# EasyEDA Pro project ProPrj_LogicV2_2025-08-26.epro

# Schematic LogicV2
Board Name: LogicV2; Create Date: 2025-08-20; Page Name: P1; Project Name: LogicV2; Schematic Name: LogicV2; Update Date: 2025-08-20; Company: 嘉立创EDA; Page Size: A4; Version: V1.0
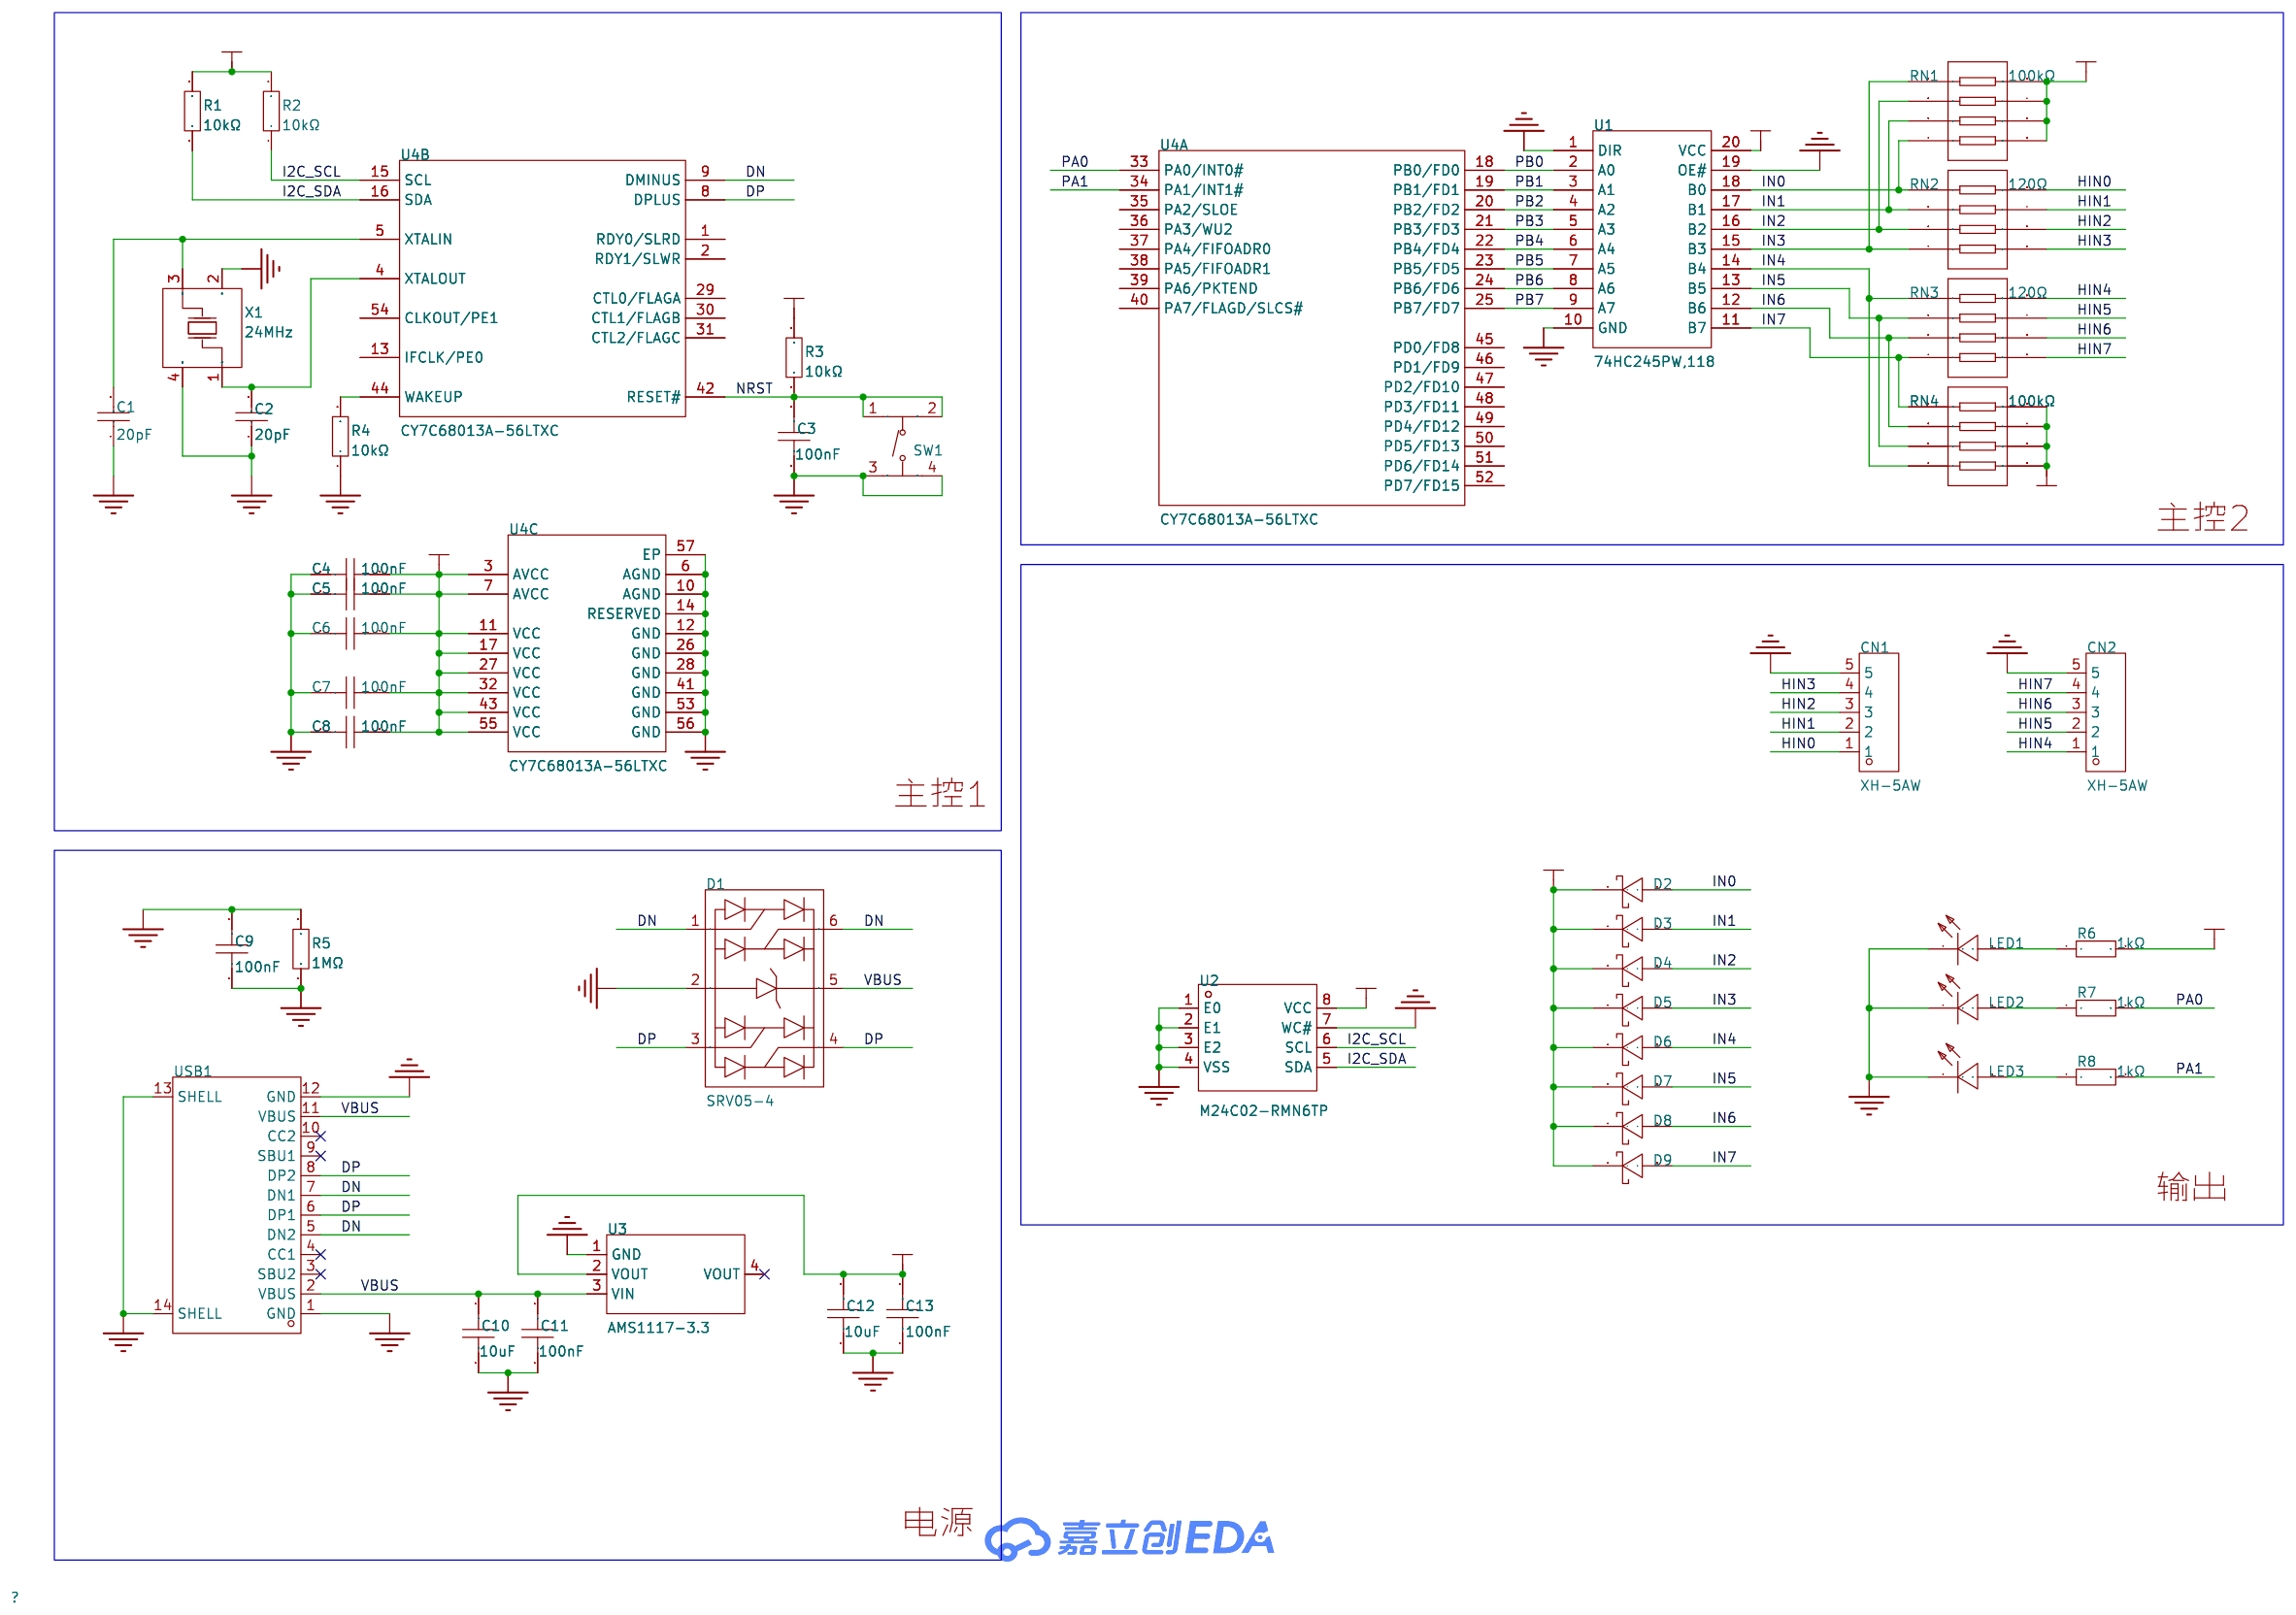
[diagram p0: schematic sheet]

## Parts
C1  20pF  [C0603]
C2  20pF  [C0603]
C3  100nF  [C0603]
C4  100nF  [C0603]
C5  100nF  [C0603]
C6  100nF  [C0603]
C7  100nF  [C0603]
C8  100nF  [C0603]
C9  100nF  [C0603]
C10  10uF  [C0805]
C11  100nF  [C0603]
C12  10uF  [C0805]
C13  100nF  [C0603]
CN1  XH-5AW  [CONN-TH_5P-P2.54_XH-5AW_C2908614]
CN2  XH-5AW  [CONN-TH_5P-P2.54_XH-5AW_C2908614]
D1  SRV05-4  [SOT-23-6_L2.9-W1.6-P0.95-LS2.8-BL]
D2  B5819W SL  [SOD-123_L2.7-W1.6-LS3.7-RD-1]
D3  B5819W SL  [SOD-123_L2.7-W1.6-LS3.7-RD-1]
D4  B5819W SL  [SOD-123_L2.7-W1.6-LS3.7-RD-1]
D5  B5819W SL  [SOD-123_L2.7-W1.6-LS3.7-RD-1]
D6  B5819W SL  [SOD-123_L2.7-W1.6-LS3.7-RD-1]
D7  B5819W SL  [SOD-123_L2.7-W1.6-LS3.7-RD-1]
D8  B5819W SL  [SOD-123_L2.7-W1.6-LS3.7-RD-1]
D9  B5819W SL  [SOD-123_L2.7-W1.6-LS3.7-RD-1]
LED1  KT-0603R  [LED0603-RD]
LED2  KT-0603R  [LED0603-RD]
LED3  KT-0603R  [LED0603-RD]
R1  10kΩ  [R0603]
R2  10kΩ  [R0603]
R3  10kΩ  [R0603]
R4  10kΩ  [R0603]
R5  1MΩ  [R0603]
R6  1kΩ  [R0603]
R7  1kΩ  [R0603]
R8  1kΩ  [R0603]
RN1  100kΩ  [RES-ARRAY-SMD_0603-8P-L3.2-W1.6-BL]
RN2  120Ω  [RES-ARRAY-SMD_0603-8P-L3.2-W1.6-BL]
RN3  120Ω  [RES-ARRAY-SMD_0603-8P-L3.2-W1.6-BL]
RN4  100kΩ  [RES-ARRAY-SMD_0603-8P-L3.2-W1.6-BL]
SW1  TS-1187A-B-A-B  [SW-SMD_4P-L5.1-W5.1-P3.70-LS6.5-TL_H1.5]
U1  74HC245PW,118  [TSSOP-20_L6.5-W4.4-P0.65-LS6.4-BL]
U2  M24C02-RMN6TP  [SOIC-8_L4.9-W3.9-P1.27-LS6.0-BL]
U3  AMS1117-3.3  [SOT-223-3_L6.5-W3.4-P2.30-LS7.0-BR]
U4  CY7C68013A-56LTXC  [QFN-56_L8.0-W8.0-P0.50-BL-EP6.1]  (sections 1,2,3)
USB1  TYPE-C 16PIN 2MD(073)  [USB-C-SMD_TYPE-C-6PIN-2MD-073]
X1  24MHz  [CRYSTAL-SMD_4P-L3.2-W2.5-BL]

## Library data of the parts
C1 C2 = CL10C200JB8NNNC: 容值:20pF;精度:±5%;额定电压:50V;温度系数:C0G;; LCSC Part Name: 20pF ±5% 50V; Supplier Part: C1648; Manufacturer: SAMSUNG(三星); Supplier Footprint: 0603; JLCPCB Part Class: 基础库; Datasheet: https://item.szlcsc.com/datasheet/CL10C200JB8NNNC/2000.html; Supplier: LCSC; Tolerance: ±5%; Voltage Rating: 50V; Temperature Coefficient: C0G
C3-C9 C11 C13 = CC0603KRX7R9BB104: 容值:100nF;精度:±10%;额定电压:50V;温度系数:X7R;; LCSC Part Name: 100nF ±10% 50V; Supplier Part: C14663; Manufacturer: YAGEO(国巨); Supplier Footprint: 0603; JLCPCB Part Class: 基础库; Datasheet: https://atta.szlcsc.com/upload/public/pdf/source/20250214/096C4C206003071F5D32E5F0D8E7F8DF.pdf; Supplier: LCSC; Tolerance: ±10%; Voltage Rating: 50V; Temperature Coefficient: X7R
C10 C12 = CL21A106KAYNNNE_C15850: 容值:10uF;精度:±10%;额定电压:25V;温度系数:X5R;; LCSC Part Name: 10uF ±10% 25V; Supplier Part: C15850; Manufacturer: SAMSUNG(三星); Manufacturer Part: CL21A106KAYNNNE; Supplier Footprint: 0805; JLCPCB Part Class: 基础库; Datasheet: https://item.szlcsc.com/datasheet/CL21A106KAYNNNE/16532.html; Supplier: LCSC; Tolerance: ±10%; Voltage Rating: 25V; Temperature Coefficient: X5R
CN1 CN2 = XH-5AW: 插针结构:1x5P;间距:2.54mm;安装方式:弯插;参考系列:XH;总PIN数:5P;排数:1;每排PIN数:5;行距:-;额定电流:3A;触头材质:黄铜;触头镀层:锡;工作温度:-25℃~+85℃;; LCSC Part Name: 1x5P 间距:2.54mm 弯插 系列:XH; Supplier Part: C2908614; Manufacturer: HCTL(华灿天禄); Supplier Footprint: 弯插,P=2.5mm; JLCPCB Part Class: 扩展库; Datasheet: https://item.szlcsc.com/datasheet/XH-5AW/3184385.html; Supplier: LCSC; Pins Structure: 1x5P; Pitch: 2.54mm; Mounting Type: 弯插; Reference Series: XH; Number of Pins: 5P; Number of Rows: 1; Number of PINs Per Row: 5; Current Rating: 3A; Contact Material: 黄铜; Contact Plating: 锡; Operating Temperature: -25℃~+85℃
D1 = SRV05-4_C558418: 极性:单向;反向截止电压(Vrwm):5V;最大钳位电压:20V;峰值脉冲电流(Ipp):3A;峰值脉冲功率(Ppp):60W;击穿电压:6V;; LCSC Part Name: ESD，可防25kV静电; Supplier Part: C558418; Manufacturer: TECH PUBLIC(台舟); Supplier Footprint: SOT-23-6; JLCPCB Part Class: 扩展库; Datasheet: https://atta.szlcsc.com/upload/public/pdf/source/20230615/CFFDFFE99FDA0E92DF9600783B3A2A20.pdf; Supplier: LCSC; polarity: 单向; Reverse Stand-Off Voltage (Vrwm): 5V; Maximum Clamping Voltage: 20V; Peak Pulse Current (Ipp): 3A; Peak Pulse Power Dissipation (Ppp): 60W; Breakdown Voltage: 6V; Reverse Leakage Current (Ir): 500nA; Number of Lines: 四路; Operating Temperature: -55℃~+125℃; level of protection: IEC 61000-4-2; Type: ESD
D2-D9 = B5819W SL: 正向压降(Vf):600mV@1A;直流反向耐压(Vr):40V;整流电流:1A;; LCSC Part Name: 电压:40V 电流:1A; Supplier Part: C8598; Manufacturer: CJ(江苏长电/长晶); Supplier Footprint: SOD-123; JLCPCB Part Class: 基础库; Datasheet: https://item.szlcsc.com/datasheet/B5819W%2520SL/9093.html; Supplier: LCSC; Voltage - Forward(Vf@If): 600mV@1A; Voltage - DC Reverse(Vr): 40V; Current - Rectified: 1A; Non-Repetitive Peak Forward Surge Current: 9A
LED1-LED3 = KT-0603R: 发光颜色:红色;功率:-;正向电流:-;主波长:-;二极管配置:-;透镜颜色:-;色温:-;发光角度:-;载带方式:-;工作温度:-40℃~+85℃;; LCSC Part Name: 0603 红灯 高亮; Supplier Part: C2286; Manufacturer: KENTO; Supplier Footprint: 0603; JLCPCB Part Class: Basic Part; Datasheet: https://atta.szlcsc.com/upload/public/pdf/source/20160616/1466072038404.pdf; Supplier: LCSC; Emitted Color: 红色; Operating Temperature: -40℃~+85℃
R1-R4 = 0603WAF1002T5E: 电阻类型:厚膜电阻;阻值:10kΩ;精度:±1%;功率:100mW;工作电压:75V;温度系数:±100ppm/℃;; LCSC Part Name: 厚膜电阻 10kΩ ±1% 100mW; Supplier Part: C25804; Manufacturer: UNI-ROYAL(厚声); Supplier Footprint: 0603; JLCPCB Part Class: 基础库; Datasheet: https://item.szlcsc.com/datasheet/0603WAF1002T5E/26547.html; Supplier: LCSC; Type: 厚膜电阻; Tolerance: ±1%; Power(Watts): 100mW; Voltage-Supply(Max): 75V; Temperature Coefficient: ±100ppm/℃; Operating Temperature: -55℃~+155℃
R5 = 0603WAF1004T5E: 电阻类型:厚膜电阻;阻值:1MΩ;精度:±1%;功率:100mW;最大工作电压:75V;温度系数:±100ppm/℃;; LCSC Part Name: 1MΩ ±1% 100mW 厚膜电阻; Supplier Part: C22935; Manufacturer: UNI-ROYAL(厚声); Supplier Footprint: 0603; JLCPCB Part Class: 基础库; Datasheet: https://atta.szlcsc.com/upload/public/pdf/source/20200306/C422600_1E6D84923E4A46A82E41ADD87F860B5C.pdf; Supplier: LCSC; Type: 厚膜电阻; Tolerance: ±1%; Power(Watts): 100mW; Overload Voltage (Max): 75V; Temperature Coefficient: ±100ppm/℃; Operating Temperature Range: -55℃~+155℃
R6-R8 = 0603WAF1001T5E: 电阻类型:厚膜电阻;阻值:1kΩ;精度:±1%;功率:100mW;最大工作电压:75V;温度系数:±100ppm/℃;; LCSC Part Name: 1kΩ ±1% 100mW 厚膜电阻; Supplier Part: C21190; Manufacturer: UNI-ROYAL(厚声); Supplier Footprint: 0603; JLCPCB Part Class: 基础库; Datasheet: https://atta.szlcsc.com/upload/public/pdf/source/20200306/C422600_1E6D84923E4A46A82E41ADD87F860B5C.pdf; Supplier: LCSC; Type: 厚膜电阻; Tolerance: ±1%; Power(Watts): 100mW; Overload Voltage (Max): 75V; Temperature Coefficient: ±100ppm/℃; Operating Temperature Range: -55℃~+155℃
RN1 RN4 = 4D03WGJ0104T5E: 电阻器数:4;阻值:100kΩ;精度:±5%;单个元件功率:62.5mW;温度系数:±200ppm/℃;; LCSC Part Name: 100kΩ ±5%; Supplier Part: C1996; Manufacturer: UNI-ROYAL(厚声); Supplier Footprint: 0603x4; JLCPCB Part Class: 扩展库; Datasheet: https://atta.szlcsc.com/upload/public/pdf/source/20191224/C474318_2527498AE30E813171187CCD28401A71.pdf; Supplier: LCSC; Number of Resistors: 4; Tolerance: ±5%; Power(Watts): 62.5mW; Temperature Coefficient: ±200ppm/℃; Number of Pins: 8
RN2 RN3 = 4D03WGJ0121T5E: 电阻器数:4;阻值:120Ω;精度:±5%;单个元件功率:62.5mW;温度系数:±200ppm/℃;; LCSC Part Name: 120Ω ±5%; Supplier Part: C35457; Manufacturer: UNI-ROYAL(厚声); Supplier Footprint: 0603x4; JLCPCB Part Class: 扩展库; Datasheet: https://atta.szlcsc.com/upload/public/pdf/source/20191224/C474318_2527498AE30E813171187CCD28401A71.pdf; Supplier: LCSC; Number of Resistors: 4; Tolerance: ±5%; Power(Watts): 62.5mW; Temperature Coefficient: ±200ppm/℃; Number of Pins: 8
SW1 = TS-1187A-B-A-B: 电路结构:单刀单掷;按钮形状:圆形按钮;作用力:160gf;安装方式:立贴;开关长度:5.1mm;开关宽度:5.1mm;开关高度:1.5mm;带支架:不带;触点电流:50mA;额定电压(DC):12V;绝缘电阻:-;带灯:无;机械寿命:10万次;; LCSC Part Name: 5.1*5.1*1.5mm 立贴 轻触开关; Supplier Part: C318884; Manufacturer: XKB Connectivity(中国星坤); Supplier Footprint: SMD; JLCPCB Part Class: 基础库; Datasheet: https://atta.szlcsc.com/upload/public/pdf/source/20200227/C318890_053E50208A88A7BA1965D8746000774E.pdf; Supplier: LCSC; Circuit: 单刀单掷; Actuator Style: 圆形按钮; Operating Force: 160gf; Mounting Style: 立贴; Switch Length: 5.1mm; Switch Width: 5.1mm; Switch Height: 1.5mm; Strike Gundam: 不带; Contact Current: 50mA; Voltage Rating (DC): 12V; Actuator/Cap Color: 金色; With Lamp: 无; Mechanical Life: 10万次; Operating Temperature: -30℃~+85℃
U1 = 74HC245PW,118: 输入类型:-;工作电压:2V~6V;元件数:1;每个元件位数:8;灌电流(IOL):7.8mA;拉电流(IOH):7.8mA;; Supplier Part: C5626; Manufacturer: Nexperia(安世); Supplier Footprint: TSSOP-20; JLCPCB Part Class: 扩展库; Datasheet: https://atta.szlcsc.com/upload/public/pdf/source/20240724/EDC8C45902BA97AEC59E8811E3964917.pdf; Supplier: LCSC; output type: 三态; Voltage - Supply: 2V~6V; Number of Elements: 1; Number of Bits per Element: 8; Current - Output Low(IOL): 7.8mA; Current - Output High(IOH): 7.8mA; Logic Family: 74HC; Operating Temperature: -40℃~+125℃
U2 = M24C02-RMN6TP: 接口类型:I2C;存储容量:2Kbit;; Supplier Part: C83836; Manufacturer: ST(意法半导体); Supplier Footprint: SOIC-8; JLCPCB Part Class: 扩展库; Datasheet: https://atta.szlcsc.com/upload/public/pdf/source/20170713/C118273_1499918870536816701.pdf; Supplier: LCSC; Interface Type: I2C; Memory Size: 2Kbit; Supply Voltage: 1.8V~5.5V; Write Cycle Time (Tw): 5ms; Data Retention - TDR (Year): 200年; Write Cycle Endurance: 1200000次; Operating Temperature: -40℃~+85℃
U3 = AMS1117-3.3_C6186: 输出类型:固定;工作电压:16V;输出电压:3.3V;输出电流:1A;电源纹波抑制比(PSRR):72dB@(120Hz);输出极性:正极;; LCSC Part Name: 输出3.3V 1A; Supplier Part: C6186; Manufacturer: AMS; Supplier Footprint: SOT-223; JLCPCB Part Class: 基础库; Datasheet: https://item.szlcsc.com/datasheet/AMS1117-3.3/6652.html; Supplier: LCSC; Output Type: 固定; Voltage - Supply: 16V; Output Voltage: 3.3V; Output Current: 1A; Power Supply Rejection Ratio (PSRR): 72dB@(120Hz); Voltage Dropout: 1.1V@(800mA); standby current: 5mA; Features: 过流保护；过热保护; Operating Temperature: -40℃~+125℃; Output Configuration: 正极; Number of Outputs: 1
U4 = CY7C68013A-56LTXC_C14912: CPU内核:51系列;CPU最大主频:48MHz;应用领域:-;; Supplier Part: C14912; Manufacturer: Infineon/CYPRESS(赛普拉斯); Supplier Footprint: QFN-56-EP(8x8); JLCPCB Part Class: 扩展库; Datasheet: https://item.szlcsc.com/datasheet/CY7C68013A-56LTXC/15584.html; Supplier: LCSC; CPU Core: 51系列; CPU Maximum Speed: 48MHz; Program Memory Type: FLASH; Number of I/O: 24; Voltage - Supply: 3V~3.6V
USB1 = TYPE-C 16PIN 2MD(073): 连接器类型:Type-C;协议标准:USB 3.1;公母:母;安装方式:卧贴;触点数量:16P;端口数量:1;额定电流 - 电源:3A;工作温度:-25℃~+85℃;; LCSC Part Name: Type-C 母 卧贴; Supplier Part: C2765186; Manufacturer: SHOU HAN(首韩); Supplier Footprint: SMD; JLCPCB Part Class: 扩展库; Datasheet: https://item.szlcsc.com/datasheet/TYPE-C%252016PIN%25202MD(073)/2901843.html; Supplier: LCSC; Connector Type: Type-C; Protocol Standard: USB 3.1; Gender: 母; Mounting Type: 卧贴; Number of Contacts: 16P; Number of Ports: 1; Current Rating-Power: 3A; Voltage Rating: 5V; Connect-Disconnect Life: 5千次; Detection color: 黑色; Operating Temperature: -25℃~+85℃
X1 = X322524MSB4SI: 晶振类型:贴片晶振;频率:24MHz;常温频差:±10ppm;负载电容:20pF;频率稳定度:±20ppm;; LCSC Part Name: YSX321SL 24MHZ 4P 3225 20PF ±10PPM -40~85℃ (±20PPM); Supplier Part: C15643; Manufacturer: YXC(扬兴晶振); Supplier Footprint: SMD3225-4P; JLCPCB Part Class: 扩展库; Datasheet: https://item.szlcsc.com/datasheet/X322524MSB4SI/16324.html; Supplier: LCSC; Type: 贴片晶振; Normal temperature Frequency Tolerance: ±10ppm; Load Capacitance: 20pF; Frequency Stability: ±20ppm; Operating Temperature: -40℃~+85℃

## Nets
3V3: C4.2 C5.2 C6.2 C7.2 C8.2 C12.2 C13.2 D2.1(-) D3.1(-) D4.1(-) D5.1(-) D6.1(-) D7.1(-) D8.1(-) D9.1(-) R1.2 R2.2 R3.2 R6.2 RN1.5 RN1.6 RN1.7 RN1.8 RN4.5 RN4.6 RN4.7 RN4.8 U1.20(VCC) U2.8(VCC) U3.2(VOUT) U4.3(AVCC) U4.7(AVCC) U4.11(VCC) U4.17(VCC) U4.27(VCC) U4.32(VCC) U4.43(VCC) U4.55(VCC)
GND: C1.1 C2.1 C3.1 C4.1 C5.1 C6.1 C7.1 C8.1 C9.1 C10.1 C11.1 C12.1 C13.1 CN1.5 CN2.5 D1.2 LED1.1(K) LED2.1(K) LED3.1(K) R4.1 R5.1 SW1.3(C) SW1.4(D) U1.1(DIR) U1.10(GND) U1.19(OE#) U2.1(E0) U2.2(E1) U2.3(E2) U2.4(VSS) U2.7(WC#) U3.1(GND) U4.6(AGND) U4.10(AGND) U4.12(GND) U4.14(RESERVED) U4.26(GND) U4.28(GND) U4.41(GND) U4.53(GND) U4.56(GND) U4.57(EP) USB1.1(GND) USB1.12(GND) X1.2(GND) X1.4(GND)
VBUS: C10.2 C11.2 D1.5 U3.3(VIN) USB1.2(VBUS) USB1.11(VBUS)
DN: D1.1 D1.6 U4.9(DMINUS) USB1.5(DN2) USB1.7(DN1)
DP: D1.3 D1.4 U4.8(DPLUS) USB1.6(DP1) USB1.8(DP2)
EGND: C9.2 R5.2 USB1.13(SHELL) USB1.14(SHELL)
HIN0: CN1.1 RN2.8
HIN1: CN1.2 RN2.7
HIN2: CN1.3 RN2.6
HIN3: CN1.4 RN2.5
HIN4: CN2.1 RN3.8
HIN5: CN2.2 RN3.7
HIN6: CN2.3 RN3.6
HIN7: CN2.4 RN3.5
I2C_SCL: R2.1 U2.6(SCL) U4.15(SCL)
I2C_SDA: R1.1 U2.5(SDA) U4.16(SDA)
IN0: D2.2(+) RN1.4 RN2.1 U1.18(B0)
IN1: D3.2(+) RN1.3 RN2.2 U1.17(B1)
IN2: D4.2(+) RN1.2 RN2.3 U1.16(B2)
IN3: D5.2(+) RN1.1 RN2.4 U1.15(B3)
IN4: D6.2(+) RN3.1 RN4.4 U1.14(B4)
IN5: D7.2(+) RN3.2 RN4.3 U1.13(B5)
IN6: D8.2(+) RN3.3 RN4.2 U1.12(B6)
IN7: D9.2(+) RN3.4 RN4.1 U1.11(B7)
NRST: C3.2 R3.1 SW1.1(A) SW1.2(B) U4.42(RESET#)
PA0: R7.2 U4.33(PA0/INT0#)
PA1: R8.2 U4.34(PA1/INT1#)
PB0: U1.2(A0) U4.18(PB0/FD0)
PB1: U1.3(A1) U4.19(PB1/FD1)
PB2: U1.4(A2) U4.20(PB2/FD2)
PB3: U1.5(A3) U4.21(PB3/FD3)
PB4: U1.6(A4) U4.22(PB4/FD4)
PB5: U1.7(A5) U4.23(PB5/FD5)
PB6: U1.8(A6) U4.24(PB6/FD6)
PB7: U1.9(A7) U4.25(PB7/FD7)
$1N986: C1.2 U4.5(XTALIN) X1.3(OSC2)
$1N999: C2.2 U4.4(XTALOUT) X1.1(OSC1)
$1N1303: R4.2 U4.44(WAKEUP)
$1N5358: LED2.2(A) R7.1
$1N5363: LED1.2(A) R6.1
$1N5368: LED3.2(A) R8.1

Not connected (* = marked no-connect by the designer): U3 4(VOUT)*; U4 1(RDY0/SLRD) 2(RDY1/SLWR) 13(IFCLK/PE0) 29(CTL0/FLAGA) 30(CTL1/FLAGB) 31(CTL2/FLAGC) 35(PA2/SLOE) 36(PA3/WU2) 37(PA4/FIFOADR0) 38(PA5/FIFOADR1) 39(PA6/PKTEND) 40(PA7/FLAGD/SLCS#) 45(PD0/FD8) 46(PD1/FD9) 47(PD2/FD10) 48(PD3/FD11) 49(PD4/FD12) 50(PD5/FD13) 51(PD6/FD14) 52(PD7/FD15) 54(CLKOUT/PE1); USB1 3(SBU2)* 4(CC1)* 9(SBU1)* 10(CC2)*

## Notes on the sheet
- 主控2
- 主控1
- 输出
- 电源

# Board Logic-250820
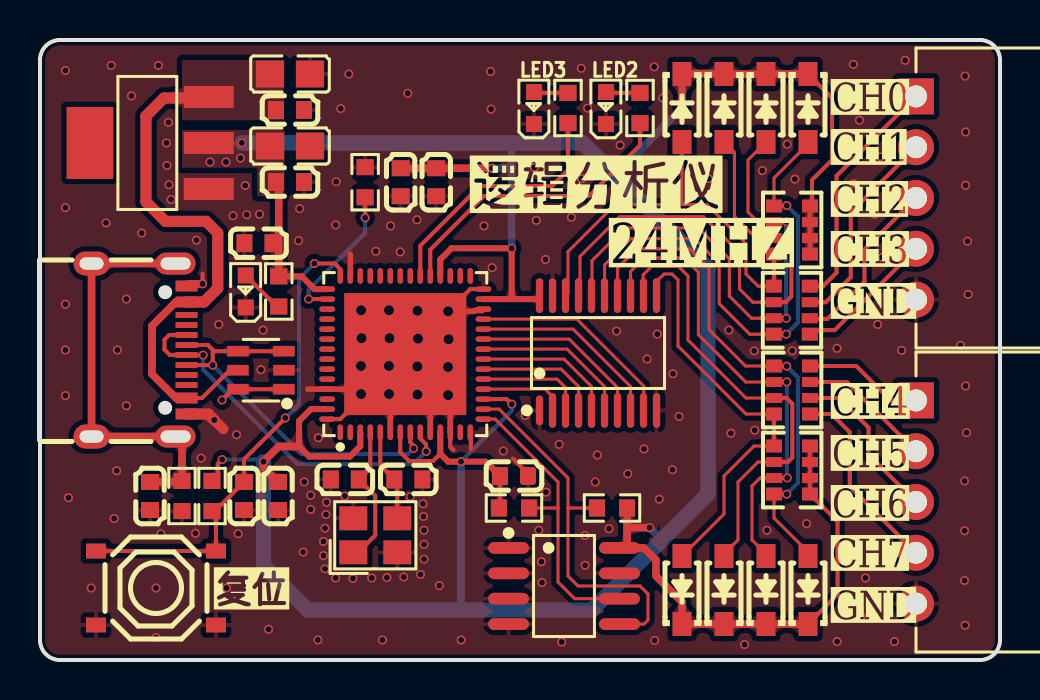
[diagram p1: board, top side]
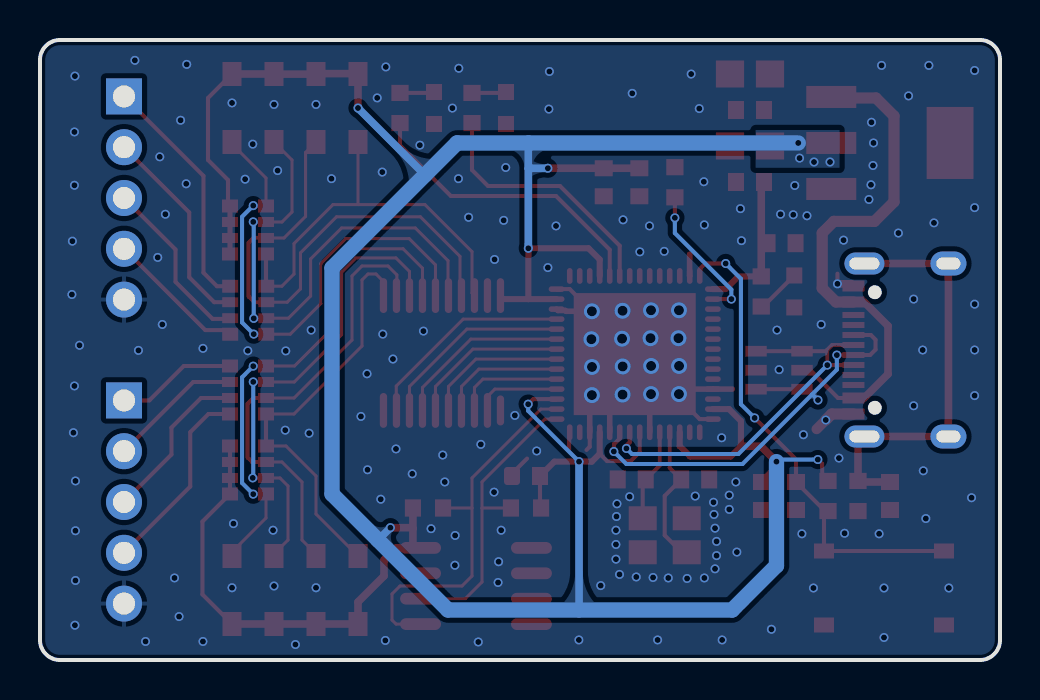
[diagram p2: board, bottom side, seen from below]

Outline 48 x 31 mm; copper layers: Top Layer, Bottom Layer. Coordinates in mm from the lower left corner of the outline.
Outline path: 0,30 0,1 arc(0.29,0.29) 1,0 47,0 arc(47.71,0.29) 48,1 48,30 arc(47.71,30.71) 47,31 1,31 arc(0.29,30.71) 0,30
Stack: Top Layer 0.035mm / Dielectric1 1.51mm FR4 er 4.5 / Bottom Layer 0.035mm

## Design rules (mm)
template: 自定义配置
spacing copperThickness1oz (default): track to track 0.102, other pairs 0.152 to 0.3
spacing copperThickness2oz: track to track 0.203, other pairs 0.152 to 0.3
track width copperThickness1oz (default): min 0.127, default 0.203, max 2.54
track width copperThickness2oz: min 0.203, default 0.254, max 2.54
differential pair differentialPair (default): width min 0.127, default 0.254, max 2.54; gap min 0.152, default 0.152
via viaSize (default): diameter min 0.4, default 0.45, max 10; hole min 0.3, default 0.3, max 6.3

## Placement (name value [footprint] x y rotation side)
C1  20pF  [C0603]  18.41 9.03 180 top
C2  20pF  [C0603]  15.24 9.03 0 top
C3  100nF  [C0603]  10.2 8.2 90 top
C4  100nF  [C0603]  11.9 8.2 90 top
C5  100nF  [C0603#2]  23.7 9.2 180 top
C6  100nF  [C0603]  19.81 23.89 90 top
C7  100nF  [C0603]  18.03 23.89 90 top
C8  100nF  [C0603]  10.92 20.84 0 top
C9  100nF  [C0603]  5.5 8.2 90 top
C10  10uF  [C0805]  12.5 29.3 180 top
C11  100nF  [C0603]  12.5 27.5 180 top
C12  10uF  [C0805]  12.5 25.7 180 top
C13  100nF  [C0603]  12.5 23.9 180 top
CN1  XH-5AW  [CONN-TH_5P-P2.54_XH-5AW_C2908614]  43.8 23.1 270 top
CN2  XH-5AW  [CONN-TH_5P-P2.54_XH-5AW_C2908614]  43.8 7.9 270 top
D1  SRV05-4  [SOT-23-6_L2.9-W1.6-P0.95-LS2.8-BL]  11.05 14.49 90 top
D2  B5819W SL  [SOD-123_L2.7-W1.6-LS3.7-RD-1]  32.1 27.6 270 top
D3  B5819W SL  [SOD-123_L2.7-W1.6-LS3.7-RD-1]  34.2 27.6 270 top
D4  B5819W SL  [SOD-123_L2.7-W1.6-LS3.7-RD-1]  36.3 27.6 270 top
D5  B5819W SL  [SOD-123_L2.7-W1.6-LS3.7-RD-1]  38.4 27.6 270 top
D6  B5819W SL  [SOD-123_L2.7-W1.6-LS3.7-RD-1]  38.4 3.5 90 top
D7  B5819W SL  [SOD-123_L2.7-W1.6-LS3.7-RD-1]  36.3 3.5 90 top
D8  B5819W SL  [SOD-123_L2.7-W1.6-LS3.7-RD-1]  34.2 3.5 90 top
D9  B5819W SL  [SOD-123_L2.7-W1.6-LS3.7-RD-1]  32.1 3.5 90 top
LED1  KT-0603R  [LED0603-RD]  10.29 18.43 90 top
LED2  KT-0603R  [LED0603-RD]  28.3 27.6 90 top
LED3  KT-0603R  [LED0603-RD]  24.7 27.6 90 top
R1  10kΩ  [R0603]  28.6 7.6 0 top
R2  10kΩ  [R0603]  23.7 7.6 180 top
R3  10kΩ  [R0603]  8.6 8.2 90 top
R4  10kΩ  [R0603]  16.26 23.89 270 top
R5  1MΩ  [R0603]  7.1 8.2 90 top
R6  1kΩ  [R0603]  11.94 18.43 90 top
R7  1kΩ  [R0603]  30 27.6 270 top
R8  1kΩ  [R0603]  26.4 27.6 270 top
RN1  100kΩ  [RES-ARRAY-SMD_0603-8P-L3.2-W1.6-BL]  37.6 21.5 270 top
RN2  120Ω  [RES-ARRAY-SMD_0603-8P-L3.2-W1.6-BL]  37.59 17.49 270 top
RN3  120Ω  [RES-ARRAY-SMD_0603-8P-L3.2-W1.6-BL]  37.6 13.5 270 top
RN4  100kΩ  [RES-ARRAY-SMD_0603-8P-L3.2-W1.6-BL]  37.6 9.5 270 top
SW1  TS-1187A-B-A-B  [SW-SMD_4P-L5.1-W5.1-P3.70-LS6.5-TL_H1.5]  5.8 3.6 0 top
U1  74HC245PW,118  [TSSOP-20_L6.5-W4.4-P0.65-LS6.4-BL]  27.9 15.35 0 top
U2  M24C02-RMN6TP  [SOIC-8_L4.9-W3.9-P1.27-LS6.0-BL]  26.2 3.7 270 top
U3  AMS1117-3.3  [SOT-223-3_L6.5-W3.4-P2.30-LS7.0-BR]  5.47 25.85 0 top
U4  CY7C68013A-56LTXC  [QFN-56_L8.0-W8.0-P0.50-BL-EP6.1]  18.26 15.3 0 top
USB1  TYPE-C 16PIN 2MD(073)  [USB-C-SMD_TYPE-C-6PIN-2MD-073]  4.95 15.5 270 top
X1  24MHz  [CRYSTAL-SMD_4P-L3.2-W2.5-BL]  16.76 6.23 0 top

## Footprints (pads in the part's own frame, mm; a bottom-side part is the same pattern mirrored in y, then rotated)
C0603
  rect 0.8x0.9 smd: 1(-0.7,0) 2(0.7,0)
C0603#2
  rrect 0.8x0.9 smd: 1(-0.7,0)
  rect 0.8x0.9 smd: 2(0.7,0)
C0805
  rect 1.41x1.35 smd: 1(-1,0) 2(1,0)
CONN-TH_5P-P2.54_XH-5AW_C2908614
  rect 1.8x1.8 hole 1.1: 1(-5.08,0)
  round 1.8 hole 1.1: 2(-2.54,0) 3(0,0) 4(2.54,0) 5(5.08,0)
CRYSTAL-SMD_4P-L3.2-W2.5-BL
  rect 1.4x1.2 smd: 1(-1.1,-0.85) 2(1.1,-0.85) 3(1.1,0.85) 4(-1.1,0.85)
LED0603-RD
  rect 0.8x0.8 smd: 1(-0.799,0) 2(0.799,0)
QFN-56_L8.0-W8.0-P0.50-BL-EP6.1
  oval 0.28x0.79 smd: 1(-3.25,-3.908) 2(-2.75,-3.908) 3(-2.25,-3.908) 4(-1.75,-3.908) 5(-1.25,-3.908) 6(-0.75,-3.908) 7(-0.25,-3.908) 8(0.25,-3.908) 9(0.75,-3.908) 10(1.25,-3.908) 11(1.75,-3.908) 12(2.25,-3.908) 13(2.75,-3.908) 14(3.25,-3.908) 29(3.25,3.908) 30(2.75,3.908) 31(2.25,3.908) 32(1.75,3.908) 33(1.25,3.908) 34(0.75,3.908) 35(0.25,3.908) 36(-0.25,3.908) 37(-0.75,3.908) 38(-1.25,3.908) 39(-1.75,3.908) 40(-2.25,3.908) 41(-2.75,3.908) 42(-3.25,3.908)
  oval 0.79x0.28 smd: 15(3.908,-3.25) 16(3.908,-2.75) 17(3.908,-2.25) 18(3.908,-1.75) 19(3.908,-1.25) 20(3.908,-0.75) 21(3.908,-0.25) 22(3.908,0.25) 23(3.908,0.75) 24(3.908,1.25) 25(3.908,1.75) 26(3.908,2.25) 27(3.908,2.75) 28(3.908,3.25) 43(-3.908,3.25) 44(-3.908,2.75) 45(-3.908,2.25) 46(-3.908,1.75) 47(-3.908,1.25) 48(-3.908,0.75) 49(-3.908,0.25) 50(-3.908,-0.25) 51(-3.908,-0.75) 52(-3.908,-1.25) 53(-3.908,-1.75) 54(-3.908,-2.25) 55(-3.908,-2.75) 56(-3.908,-3.25)
  rect 6.1x6.1 smd: 57(0,0)
R0603
  rect 0.806x0.864 smd: 1(-0.753,0) 2(0.753,0)
RES-ARRAY-SMD_0603-8P-L3.2-W1.6-BL
  rect 0.65x0.8 smd: 1(-1.2,-0.9) 4(1.2,-0.9) 5(1.2,0.9) 8(-1.2,0.9)
  rect 0.5x0.8 smd: 2(-0.4,-0.9) 3(0.4,-0.9) 6(0.4,0.9) 7(-0.4,0.9)
SOD-123_L2.7-W1.6-LS3.7-RD-1
  rect 1.2x0.95 smd: 1(-1.7,0) 2(1.7,0)
SOIC-8_L4.9-W3.9-P1.27-LS6.0-BL
  oval 0.588x2.045 smd: 1(-1.905,-2.772) 2(-0.635,-2.772) 3(0.635,-2.772) 4(1.905,-2.772) 5(1.905,2.772) 6(0.635,2.772) 7(-0.635,2.772) 8(-1.905,2.772)
SOT-23-6_L2.9-W1.6-P0.95-LS2.8-BL
  rect 0.532x1.072 smd: 1(-0.95,-1.149) 2(0,-1.149) 3(0.95,-1.149) 4(0.95,1.149) 5(0,1.149) 6(-0.95,1.149)
SOT-223-3_L6.5-W3.4-P2.30-LS7.0-BR
  rect 2.5x1.1 smd: 1(2.97,-2.3) 2(2.97,0) 3(2.97,2.3)
  rect 2.34x3.6 smd: 4(-2.97,0)
SW-SMD_4P-L5.1-W5.1-P3.70-LS6.5-TL_H1.5
  rect 1x0.75 smd: 1(-3,1.85) 2(3,1.85) 3(-3,-1.85) 4(3,-1.85)
TSSOP-20_L6.5-W4.4-P0.65-LS6.4-BL
  oval 0.364x1.5 smd: 1(-2.925,-2.871)
  oval 0.364x1.742 smd: 2(-2.275,-2.871) 3(-1.625,-2.871) 4(-0.975,-2.871) 5(-0.325,-2.871) 6(0.325,-2.871) 7(0.975,-2.871) 8(1.625,-2.871) 9(2.275,-2.871) 10(2.925,-2.871) 11(2.925,2.871) 12(2.275,2.871) 13(1.625,2.871) 14(0.975,2.871) 15(0.325,2.871) 16(-0.325,2.871) 17(-0.975,2.871) 18(-1.625,2.871) 19(-2.275,2.871) 20(-2.925,2.871)
USB-C-SMD_TYPE-C-6PIN-2MD-073
  rect 0.55x1.1 smd: 1(-3.2,2.375) 2(-2.4,2.375) 11(2.4,2.375) 12(3.2,2.375)
  rect 0.3x1.1 smd: 3(-1.75,2.375) 4(-1.25,2.375) 5(-0.75,2.375) 6(-0.25,2.375) 7(0.25,2.375) 8(0.75,2.375) 9(1.25,2.375) 10(1.75,2.375)
  oval 1.1x2 hole 0.6x1.5: 13(-4.325,1.825) 14(4.325,1.825)
  oval 1.2x1.8 hole 0.6x1.2: 13(-4.325,-2.375) 14(4.325,-2.375)

## Nets
As in the schematic.

Pads without a net: U3 4; U4 1 2 13 29 30 31 35 36 37 38 39 40 45 46 47 48 49 50 51 52 54; USB1 3 4 9 10

## Via types
v1: diameter 0.45, hole 0.3, Top Layer to Bottom Layer, 191 vias
v2: diameter 0.8, hole 0.5, Top Layer to Bottom Layer, 16 vias

## Routing (per net, layer and track width the routed paths; a pad name or vN(x,y) marks a point on that pad's centre or on a via; arc(x,y) is an arc through that point)
3V3: length 181.6
  Top Layer w0.203: U4.7 18.01,10.39 18.46,9.95 19.65,9.95 20.01,10.31 ; D6.1 39.88,3.28 39.88,6.92 RN4.5 RN4.6 RN4.7 RN4.8 ; v1(9.11,10.02) 8.89,9.81 8.89,9.24 R3.2 ; U4.17 23.34,13.05 v1(23.59,12.79) ; C5.2 23,7.65 R2.2 ; RN1.8 38.6,22.8 38.6,24 39.6,25 39.6,28.1 D5.1
  Top Layer w0.254: RN1.5 RN1.6 RN1.7 RN1.8
  Top Layer w0.305: U4.11 20.01,10.31 20.41,9.92 v1(21.05,9.92) 22.28,9.92 C5.2 ; U4.3 16.01,10.69 15.49,10.17 13.46,10.17 12.95,10.68 12.95,11.95 13.55,12.55 U4.55 ; U4.27 23.59,18.05 ; 23.59,18.05 24.98,18.05 U1.20 ; 23.59,18.05 23.58,18.05 v1(23.58,20.59) 20.57,20.59 20.01,20.03 U4.32 ; U4.43 13.72,18.55 13.09,19.18 R6.2
  Top Layer w0.381: R6.2 11.94,23.76 C13.2 ; D5.1 D4.1 36.29,29.29 34.21,29.29 D3.1 34.18,29.32 32.12,29.32 D2.1 v1(32.1,27.6) ; v1(30.48,6.62) 29.39,6.62 29.35,6.58 ; 29.22,5.61 U2.8 ; 29.22,5.61 29.35,5.74 29.35,6.58 ; 29.22,5.61 30.19,5.61 30.8,5 30.8,4.2 32.1,2.9 D9.1 D8.1 D7.1 D6.1 ; 12.95,10.68 11.94,10.68 v1(11.18,9.92) 11.18,9.62 C4.2 ; C7.2 C6.2 v1(22.61,24.59) ; R1.2 29.35,6.58
  Bottom Layer w0.203: v1(9.11,10.02) 11.07,10.02 v1(11.18,9.92) ; v1(21.05,9.92) 23.59,12.46 v1(23.59,12.79)
  Bottom Layer w0.381: v1(23.58,20.59) 23.58,24.57 ; 23.58,24.57 23.58,25.85 ; 23.58,24.57 23.57,24.59 v1(22.61,24.59) ; v1(30.48,6.62) 31.1,6 ; v1(21.05,9.92) 21.05,2.5 ; v1(32.1,27.6) 28.75,24.25
  Bottom Layer w0.762: v1(10.09,25.85) 27.15,25.85 33.4,19.6 33.4,8.3 27.6,2.5 13.39,2.5 11.18,4.72 v1(11.18,9.92)
  vias: v1(8.5,24.9) v1(9.3,24.9) v1(10.02,25.09)
GND: length 29.4
  Top Layer w0.203: 21.54,10.55 21.54,11.36 U4.14 ; v2(20.41,17.44) 21.51,18.55 U4.28 ; 23.65,10.07 24.4,9.32 C5.1 ; 20.68,10.5 20.51,10.66 U4.12 ; v1(8.13,18.81) 8.13,19.32 ; 16.51,13.55 15.01,12.05 U4.56
  Top Layer w0.28: 15.52,20.28 15.52,19.21 U4.41 ; U4.57 v2(20.41,17.44) 21.7,17.44 21.74,17.48 22.1,17.48 U4.26 ; U4.6 17.51,14.55 ; U4.12 20.51,13.05 19.51,14.05 U4.10 ; 13.39,13.55 U4.53 16.51,13.55
  Top Layer w0.381: v1(8.13,18.81) 7.44,18.81 USB1.1
  Top Layer w0.508: v1(8.71,12) 9.17,11.54
  Top Layer w0.559: v1(8.71,12) 8.41,12.3 USB1.12
  vias: v1(1.27,29.48) v1(1.27,22.62) v1(1.27,17.79) v1(1.27,15.5) v1(1.27,13.22) v1(1.42,8.11) v1(2.56,3.6) v1(3.3,21.86) v1(3.56,29.73) v1(3.71,7.07) v1(3.84,9.46) v1(3.87,15.5) v1(4.32,18.05) v1(4.32,12.71) v1(4.57,28.21) v1(5.08,21.35) v1(5.8,3.6) v1(5.8,1.12) v1(5.92,29.73) v1(6.05,6.31) v1(6.32,25.85) v1(6.35,24.73) v1(6.43,26.89) v1(6.45,23.76) v1(6.55,23.02) v1(7.82,20.99) v1(7.77,6.34) v1(8.05,10.1) v1(8.94,16.78) v1(9.33,3.6) v1(9.65,22.21) v1(9.83,11.26) v1(9.91,6.31) v1(10.26,23.73) v1(10.34,22.26) v1(10.97,22.29) v1(11.04,14.52) v1(11.15,16.5) v1(11.43,1.54) v1(12.93,20.97) v1(12.98,22.57) v1(13.21,8.9) v1(13.16,5.4) v1(13.54,8.24) v1(13.54,7.53) v1(13.92,11.11) v1(13.89,1) v1(14.25,6.59) v1(14.17,5.93) v1(14.17,5.22) v1(14.25,4.56) v1(14.33,7.89) v1(14.3,7.28) v1(14.81,23.91) v1(14.78,21.75) v1(14.78,4.1) v1(15.04,27.57) v1(15.24,8.2) v1(15.44,29.3) v1(15.65,4.08) v1(16.59,4.1) v1(16.79,20.43) v1(17.12,1) v1(17.35,4.13) v1(17.53,21.7) v1(18.01,20.41) v1(18.19,4.15) v1(18.39,28.33) v1(18.52,8.17) v1(18.85,22.01) v1(19.02,4.28) v1(19.15,7.81) v1(19.18,7.17) v1(19.2,6.49) v1(19.2,5.78) v1(19.2,5.04) v1(19.96,3.72) v1(21.06,1) v1(22.2,21.7) v1(22.53,29.42) v1(22.56,27.55) v1(22.61,19.62) v1(23.16,10.45) v1(24.26,12.23) v1(24.71,24.62) v1(24.82,21.98) v1(24.94,6.49) v1(25.07,4.91) v1(25.1,3.87) v1(25.27,20.03) v1(25.3,8.39) v1(25.96,10.78) v1(26.09,0.9) v1(26.57,22.14) v1(27.06,29.59) v1(27.08,24.07) v1(27.24,6.23) v1(27.25,4.74) v1(27.38,27.6) v1(27.76,8.9) v1(27.86,10.25) v1(28.45,6.56) v1(28.83,16.45) v1(29.01,25.74) v1(29.39,9.31) v1(30.2,10.55) v1(30.35,15.05) v1(30.71,29.65) v1(30.73,0.98) v1(30.89,24.4) v1(30.86,16.29) v1(30.96,8.04) v1(31.14,28.1) v1(31.65,14.31) v1(31.62,9.51) v1(31.95,12.18) v1(33.43,24.07) v1(34.2,27.78) v1(34.2,3.61) v1(34.44,16.5) v1(34.54,11.34) v1(35.23,0.77) v1(35.71,15.45) v1(35.74,11.49) v1(36.12,24.47) v1(36.3,27.78) v1(36.35,6.49) v1(36.3,3.7) v1(37.36,25.79) v1(37.61,15.46) v1(37.74,24.04) v1(38.33,6.82) v1(38.4,27.85) v1(38.4,3.61) v1(39.85,15.58) v1(39.85,0.93) v1(40.67,29.78) v1(40.69,23.81) v1(40.97,26.99) v1(41.05,2.17) v1(41.28,4.1) v1(41.73,22.29) v1(41.88,16.78) v1(42.01,25.16) v1(42.11,20.13) v1(42.72,0.93) v1(43.08,15.48) v1(43.26,29.98) v1(46.03,15.73) v1(46.23,8.95) v1(46.23,6.46) v1(46.23,3.97) v1(46.25,29.2) v1(46.28,26.4) v1(46.28,23.74) v1(46.28,13.7) v1(46.33,11.37) v1(46.25,1.74) v1(46.38,20.94) v1(46.41,18.27) v2(16.05,14.7) v2(16.05,17.49) v2(16.08,16.09) v2(16.05,13.3) v2(17.45,17.49) v2(17.44,14.7) v2(17.45,13.3) v2(17.47,16.09) v2(18.87,17.46) v2(18.9,16.06) v2(18.87,14.68) v2(18.87,13.27) v2(20.43,16.04) v2(20.4,14.65) v2(20.41,13.25)
VBUS: length 26.1
  Top Layer w0.203: USB1.11 8.1,13.1 9.49,14.49 D1.5
  Top Layer w0.381: USB1.11 6.79,13.1 5.6,14.29 5.6,16.71 6.79,17.9 USB1.2
  Top Layer w0.559: 7.93,28.1 6.2,28.1 5.3,27.2 5.3,22.91 6.27,21.93 8.31,21.93 8.89,21.35 8.89,18.59 8.2,17.9 USB1.2
DN: length 22.7
  Top Layer w0.203: U4.9 19.01,11.08 19.3,10.79 19.3,10.43 v1(19.31,10.43) ; v1(9.1,13) 9.64,13.54 D1.6 D1.1 ; USB1.5 6.46,16.25 6.22,16.01 6.22,15.52 6.49,15.25 USB1.7 8.15,15.25 v1(8.16,15.25)
  Bottom Layer w0.203: v1(8.16,15.25) 8.16,14.52 9.41,13.27 ; v1(19.31,10.43) 18.68,9.8 12.87,9.8 9.41,13.27 ; 9.41,13.27 9.37,13.27 v1(9.1,13)
DP: length 19.9
  Top Layer w0.203: U4.8 18.51,10.89 18.68,10.72 v1(18.68,10.58) ; 8.64,15.51 8.39,15.75 USB1.6 ; 8.64,15.51 8.7,15.44 D1.4 D1.3 ; 8.64,15.51 v1(8.64,14.74) 7.33,14.74 USB1.8
  Bottom Layer w0.203: v1(18.68,10.58) 18.4,10.3 13.08,10.3 v1(8.64,14.74)
EGND: length 21
  Top Layer w0.381: USB1.13 USB1.13 USB1.14 USB1.14 7.1,10.85 R5.2 7.05,8.9 C9.2
HIN0: length 12.1
  Top Layer w0.203: RN2.8 39.15,18.69 39.83,19.37 39.83,24.21 CN1.1
HIN1: length 10.4
  Top Layer w0.203: RN2.7 39.29,17.89 40.54,19.14 40.54,22.38 CN1.2
HIN2: length 8.8
  Top Layer w0.203: CN1.3 41.22,20.52 41.22,18.91 39.37,17.06 38.52,17.06 RN2.6
HIN3: length 7.1
  Top Layer w0.203: RN2.5 38.7,16.5 39.74,16.5 CN1.4
HIN4: length 6
  Top Layer w0.203: RN3.8 40.81,14.7 42.53,12.98 CN2.1
HIN5: length 6.7
  Top Layer w0.203: RN3.7 40.34,13.9 CN2.2
HIN6: length 8.2
  Top Layer w0.203: CN2.3 41.43,10.27 41.43,11.62 39.95,13.1 RN3.6
HIN7: length 9.8
  Top Layer w0.203: RN3.5 39.58,12.3 40.49,11.39 40.49,8.67 CN2.4
I2C_SCL: length 14.9
  Top Layer w0.152: U2.6 26.74,3.06 25.9,3.9 25.9,7.59 ; 25.9,7.59 25.89,7.6 R2.1 ; 25.9,7.59 25.9,8.9 22.75,12.05 U4.15
I2C_SDA: length 19.2
  Top Layer w0.152: 26.4,7.6 26.4,9.1 22.96,12.55 U4.16 ; 26.4,7.6 26.4,4.2 26.9,3.7 30,3.7 30.4,3.3 30.4,2 30.19,1.8 U2.5 ; 26.4,7.6 R1.1
IN0: length 20.8
  Top Layer w0.152: 32.09,22.77 28.75,22.77 26.4,20.42 26.4,18.34 U1.18 ; 32.09,22.77 33.35,22.77 35.3,20.82 35.3,19.3 35.91,18.69 RN2.1 ; 32.09,22.77 32.1,22.78 D2.2
  Top Layer w0.203: RN2.1 36.7,18.7 RN1.4
IN1: length 26.3
  Top Layer w0.152: U1.17 27,18.29 27,20.18 28.98,22.16 33.17,22.16 34.98,20.36 34.98,18.55 35.64,17.89 RN2.2 ; RN1.3 35.8,21.1 34.72,22.18 34.72,25.38 D3.2
  Top Layer w0.203: RN2.2 37.28,17.89 37.57,18.17 37.57,20.87 37.32,21.11 36.71,21.11 RN1.3
IN2: length 26
  Top Layer w0.152: U1.16 27.6,18.24 27.6,19.97 29.24,21.6 32.92,21.6 34.47,20.05 34.47,18.2 35.58,17.09 RN2.3 ; RN1.2 35.9,21.9 35.4,22.4 35.4,25 D4.2
  Top Layer w0.203: RN2.3 37.3,17.09 v1(37.31,17.08) ; RN1.2 37.33,21.9 v1(37.34,21.91)
  Bottom Layer w0.203: v1(37.34,21.91) 37.31,21.88 v1(37.31,17.08)
IN3: length 25.8
  Top Layer w0.152: D5.2 38.4,25.8 36.7,24.1 RN1.1 ; RN2.4 35.49,16.29 33.96,17.82 33.96,19.82 32.72,21.07 29.54,21.07 28.23,19.75 U1.15
  Top Layer w0.203: v1(37.34,22.72) 37.32,22.7 RN1.1 ; RN2.4 37.31,16.29 v1(37.31,16.29)
  Bottom Layer w0.203: v1(37.34,22.72) 37.9,22.16 37.9,16.88 v1(37.31,16.29)
IN4: length 25.8
  Top Layer w0.152: RN4.4 36.7,7.1 38.4,5.4 D6.2 ; U1.14 28.88,19.59 29.84,20.56 32.49,20.56 33.45,19.6 33.45,16.52 35.27,14.7 RN3.1
  Top Layer w0.203: RN4.4 37.33,8.3 v1(37.34,8.29) ; v1(37.34,14.69) 36.71,14.69 RN3.1
  Bottom Layer w0.203: v1(37.34,14.69) 37.9,14.13 37.9,8.85 v1(37.34,8.29)
IN5: length 24.2
  Top Layer w0.152: RN3.2 35.29,13.9 32.92,16.27 32.92,19.39 32.21,20.1 30.2,20.1 29.53,19.43 U1.13 ; RN4.3 36,9.1 35.6,8.7 35.6,6 36.3,5.3 D7.2
  Top Layer w0.203: RN4.3 36.71,9.11 v1(37.36,9.11) ; RN3.2 37.33,13.9 v1(37.34,13.91)
  Bottom Layer w0.203: v1(37.36,9.11) 37.34,9.13 v1(37.34,13.91)
IN6: length 23.3
  Top Layer w0.152: RN4.2 35.9,9.9 34.9,8.9 34.9,6 34.2,5.3 D8.2 ; RN3.3 35.3,13.1 32.4,16 32.4,19.2 31.9,19.7 30.6,19.7 30.16,19.26 30.16,18.24 U1.12
  Top Layer w0.203: RN4.2 37.4,9.9 37.62,10.12 37.62,12.81 37.33,13.1 RN3.3
IN7: length 21.2
  Top Layer w0.152: RN3.4 35.3,12.3 31.9,15.7 31.9,19 31.6,19.3 31.2,19.3 30.83,18.93 U1.11 ; RN4.1 35.7,10.7 34.2,9.2 34.2,7.3 D9.2
  Top Layer w0.203: RN3.4 RN4.1
NRST: length 24.4
  Top Layer w0.203: v1(12.27,12.1) 10.2,10.03 C3.2 8.75,7.45 R3.1 8.8,7.25 SW1.2 SW1.1 ; U4.42 15.01,19.54 14.73,19.82 v1(13.72,19.82)
  Bottom Layer w0.203: v1(13.72,19.82) 12.95,19.06 12.95,12.79 v1(12.27,12.1)
PA0: length 15.1
  Top Layer w0.203: R7.2 30,25.75 27.46,23.2 22.2,23.2 19.51,20.51 U4.33
PA1: length 12.8
  Top Layer w0.203: U4.34 19.01,20.71 22,23.7 25.6,23.7 26.4,24.5 R8.2
PB0: length 4.3
  Top Layer w0.152: U4.18 25.26,13.55 25.62,13.18 25.62,12.53
PB1: length 5.3
  Top Layer w0.152: 26.28,12.63 26.28,13.62 25.85,14.05 U4.19
PB2: length 6.2
  Top Layer w0.152: 26.93,12.63 26.93,13.67 26.06,14.55 U4.20
PB3: length 7
  Top Layer w0.152: U4.21 26.21,15.05 27.58,13.67 27.58,12.63
PB4: length 7.9
  Top Layer w0.152: 28.23,12.63 28.23,13.67 26.35,15.55 U4.22
PB5: length 8.7
  Top Layer w0.152: U4.23 26.46,16.05 28.88,13.62 28.88,12.63
PB6: length 9.6
  Top Layer w0.152: 29.53,12.63 29.53,13.67 26.66,16.55 U4.24
PB7: length 10.5
  Top Layer w0.152: 30.18,12.63 30.18,12.83 30.19,12.84 30.19,13.7 26.84,17.05 U4.25
$1N986: length 4.7
  Top Layer w0.203: X1.3 17.86,8.88 C1.2 17.01,9.73 U4.5
$1N999: length 7.2
  Top Layer w0.203: X1.1 15.91,5.39 16.76,6.23 16.76,8.2 C2.2 16.51,9.6 U4.4
$1N1303: length 7.2
  Top Layer w0.203: v1(16.26,22.11) R4.2 ; U4.44 v1(13.43,18.05)
  Bottom Layer w0.203: v1(16.26,22.11) 16.26,21.35 13.43,18.52 v1(13.43,18.05)
$1N5358: length 1.7
  Top Layer w0.203: R7.1 28.35,28.35 LED2.2
$1N5363: length 2.3
  Top Layer w0.203: R6.1 11.84,17.67 LED1.2
$1N5368: length 1.7
  Top Layer w0.203: R8.1 24.75,28.35 LED3.2

## Copper pours and planes (outline as drawn; the poured copper is in the pictures)
3V3 on Top Layer: 10.85,26.5 12.22,26.5 12.22,23.19 10.85,23.19
3V3 on Top Layer: 7.1,26.5 12.22,26.5 12.22,24.61 7.1,24.61
3V3 on Bottom Layer: 8.02,26.5 12.22,26.5 12.22,24.61 8.02,24.61
GND on Top Layer: -1.52,32.27 53.09,32.27 53.09,-2.78 -1.52,-2.78
GND on Top Layer: 6.66,24.34 10.26,24.34 10.26,22.62 6.66,22.62
GND on Bottom Layer: -1.52,32.27 53.09,32.27 53.09,-2.78 -1.52,-2.78
VBUS on Top Layer: 7.1,30 12.19,30 12.19,26.99 7.1,26.99

Small or netless copper shapes (teardrops, artwork), in the pictures only: 216 on Top Layer, 27 on Bottom Layer

## Text on the board
Top Silkscreen Layer: 复位 | CH0 | CH1 | CH2 | CH3 | GND | CH4 | CH5 | CH6 | CH7 | 逻辑分析仪 | 24MHZ
